# Altium project TPS631000DRLR.PrjPcb
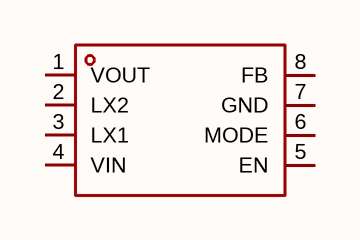
[diagram p0: TPS631000DRLR.schdoc]
1 sheet, 1 parts. Net scope: global (net labels, ports and power ports of the same name join across sheets).

## Sheet TPS631000DRLR.schdoc
size 127 x 101 mm

### Parts
U?  tps631000drlr  [SOT-583-8_L2.1-W1.2-P0.50-LS1.6-BL]  (value not drawn)

### Nets

Not connected (* = marked no-connect by the designer): U? 1(VOUT) 2(LX2) 3(LX1) 4(VIN) 5(EN) 6(MODE) 7(GND) 8(FB)

### Library data of the parts
U? = tps631000drlr: 功能类型:升降压型;工作电压:1.6V~5.5V;输出电压:1.2V~5.3V;输出电流:2A;输出类型:可调;; Manufacturer: TI(德州仪器); AddInBom: yes; ModelId: 14eb3df1056d4df2aac7ceeb7e81e738; ModelTransform: 82.677,62.992,0,0,0,0,0,0,0; Function: 升降压型; Output Current: 2A; Frequency - Switching: 2.2MHz; Topology: 降压-升压式; Quiescent Current: 8uA; Switch tube (built-in/external): 内置; Output Type: 可调; Symbol: TPS631000DRLR; LCSC Part Name: 升降压型 2A 1.6V~5.5V; SupplierPart: C5219190; ManufacturerPart: TPS631000DRLR; Supplier Footprint: SOT-583; JLCPCB Part Class: Extended Part; Datasheet: https://www.ti.com/cn/lit/ds/symlink/tps631000.pdf; Supplier: LCSC; ConvertToPcb: yes; FootprintName: SOT-583-8_L2.1-W1.2-P0.50-LS1.6-BL; ModelName: SOT-583-8_L2.1-W1.2-P0.50-LS1.6-BL; Voltage - Supply: 1.6V~5.5V; Output Voltage: 1.2V~5.3V; Operating Temperature: -40℃~+125℃; Synchronous Rectifier: -; Number of Outputs: -; Features: 轻载高效模式；过流保护；负载断开